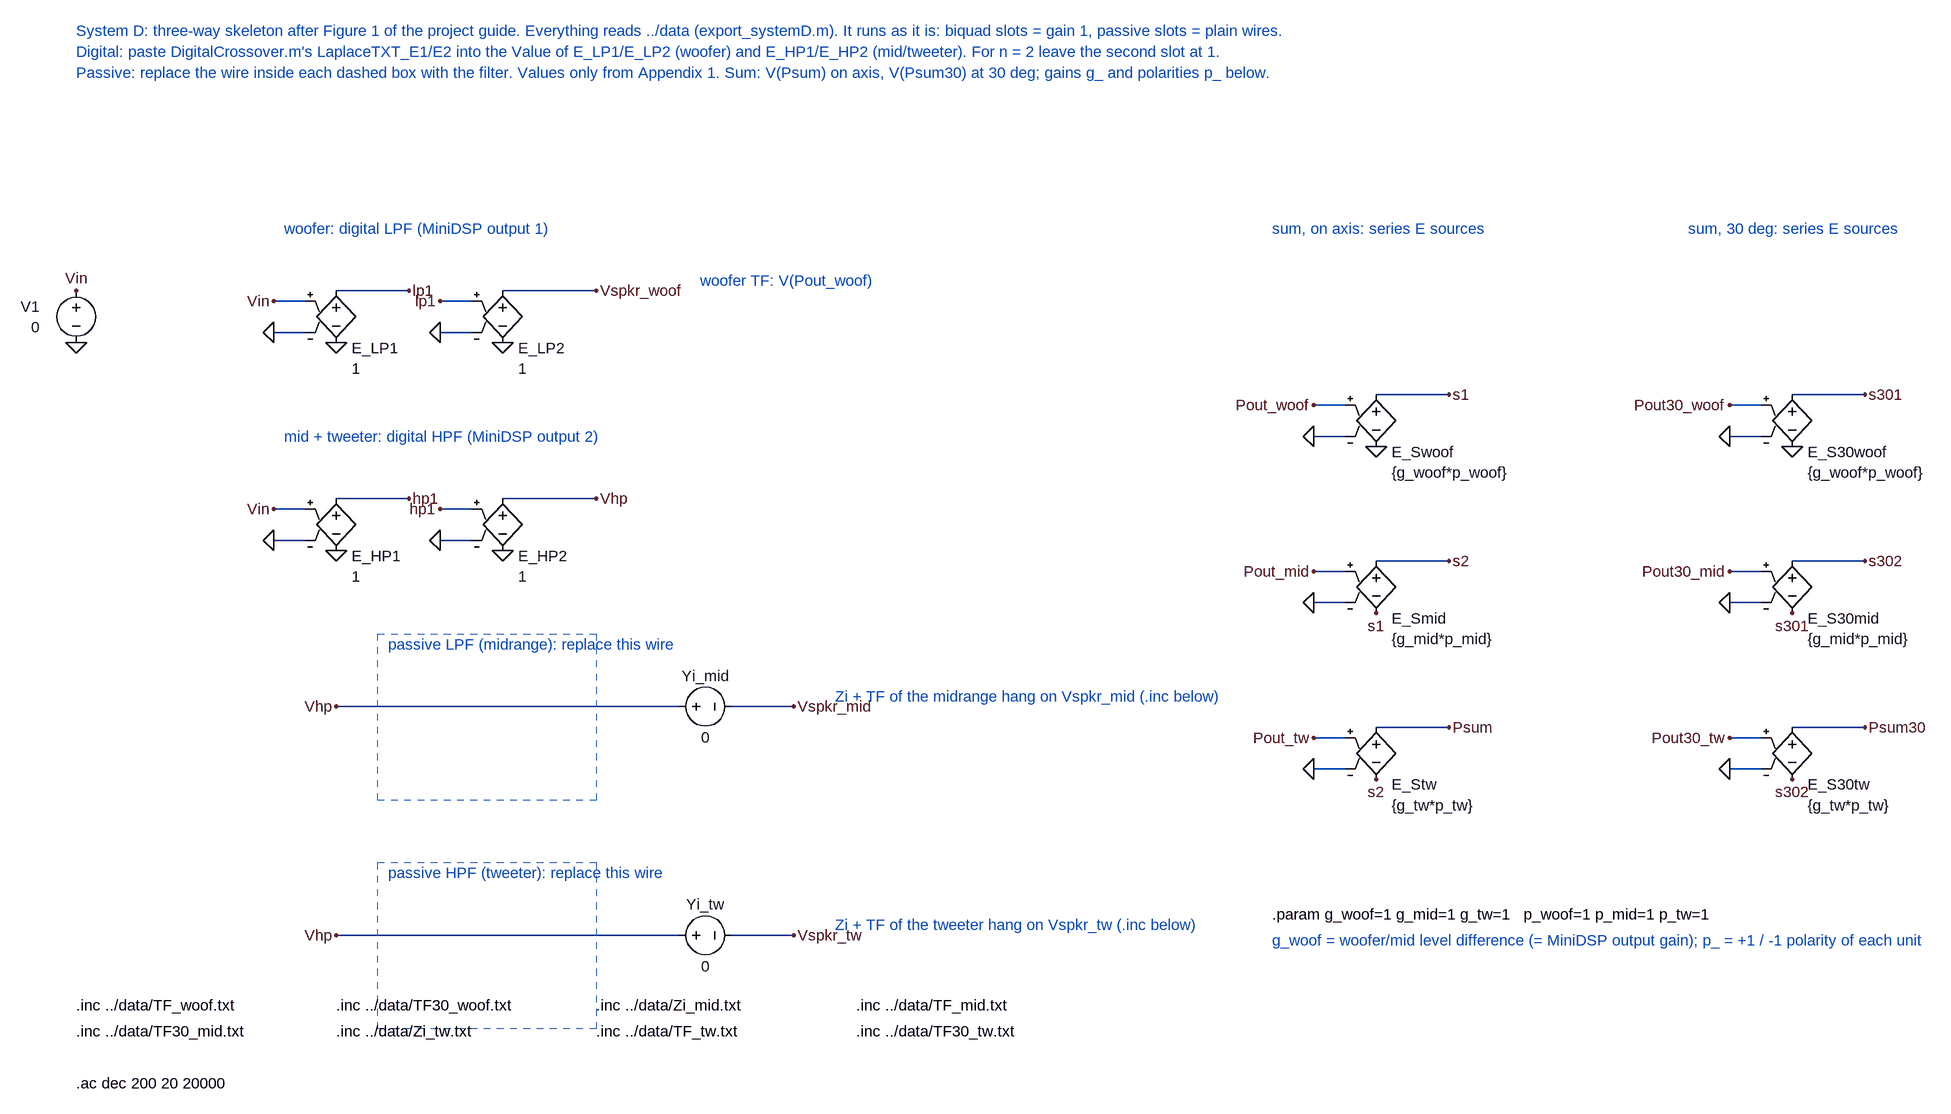
[diagram p0: schematic System_template.asc]
System_template.asc, the LTspice schematic file:
Version 4
SHEET 1 3200 1800
TEXT -400 -400 Left 2 ;System D: three-way skeleton after Figure 1 of the project guide. Everything reads ../data (export_systemD.m). It runs as it is: biquad slots = gain 1, passive slots = plain wires.
TEXT -400 -368 Left 2 ;Digital: paste DigitalCrossover.m's LaplaceTXT_E1/E2 into the Value of E_LP1/E_LP2 (woofer) and E_HP1/E_HP2 (mid/tweeter). For n = 2 leave the second slot at 1.
TEXT -400 -336 Left 2 ;Passive: replace the wire inside each dashed box with the filter. Values only from Appendix 1. Sum: V(Psum) on axis, V(Psum30) at 30 deg; gains g_ and polarities p_ below.
SYMBOL voltage -400 -16 R0
WINDOW 0 -56 40 Right 2
WINDOW 3 -56 72 Right 2
SYMATTR InstName V1
SYMATTR Value 0
SYMATTR Value2 AC 1
FLAG -400 0 Vin
FLAG -400 80 0
TEXT -80 -96 Left 2 ;woofer: digital LPF (MiniDSP output 1)
SYMBOL e 0 -16 R0
WINDOW 0 24 104 Left 2
WINDOW 3 24 136 Left 2
SYMATTR InstName E_LP1
SYMATTR Value 1
FLAG 0 80 0
WIRE -48 16 -96 16
FLAG -96 16 Vin
WIRE -48 64 -96 64
FLAG -96 64 0
WIRE 0 0 112 0
FLAG 112 0 lp1
SYMBOL e 256 -16 R0
WINDOW 0 24 104 Left 2
WINDOW 3 24 136 Left 2
SYMATTR InstName E_LP2
SYMATTR Value 1
FLAG 256 80 0
WIRE 208 16 160 16
FLAG 160 16 lp1
WIRE 208 64 160 64
FLAG 160 64 0
WIRE 256 0 400 0
FLAG 400 0 Vspkr_woof
TEXT -80 224 Left 2 ;mid + tweeter: digital HPF (MiniDSP output 2)
SYMBOL e 0 304 R0
WINDOW 0 24 104 Left 2
WINDOW 3 24 136 Left 2
SYMATTR InstName E_HP1
SYMATTR Value 1
FLAG 0 400 0
WIRE -48 336 -96 336
FLAG -96 336 Vin
WIRE -48 384 -96 384
FLAG -96 384 0
WIRE 0 320 112 320
FLAG 112 320 hp1
SYMBOL e 256 304 R0
WINDOW 0 24 104 Left 2
WINDOW 3 24 136 Left 2
SYMATTR InstName E_HP2
SYMATTR Value 1
FLAG 256 400 0
WIRE 208 336 160 336
FLAG 160 336 hp1
WIRE 208 384 160 384
FLAG 160 384 0
WIRE 256 320 400 320
FLAG 400 320 Vhp
TEXT 560 -16 Left 2 ;woofer TF: V(Pout_woof)
FLAG 0 640 Vhp
WIRE 0 640 448 640
RECTANGLE Normal 64 528 400 784 2
TEXT 80 544 Left 2 ;passive LPF (midrange): replace this wire
SYMBOL voltage 512 640 R270
WINDOW 0 32 56 VTop 2
WINDOW 3 -32 56 VBottom 2
SYMATTR InstName Yi_mid
SYMATTR Value 0
WIRE 448 640 528 640
WIRE 608 640 704 640
FLAG 704 640 Vspkr_mid
TEXT 768 624 Left 2 ;Zi + TF of the midrange hang on Vspkr_mid (.inc below)
FLAG 0 992 Vhp
WIRE 0 992 448 992
RECTANGLE Normal 64 880 400 1136 2
TEXT 80 896 Left 2 ;passive HPF (tweeter): replace this wire
SYMBOL voltage 512 992 R270
WINDOW 0 32 56 VTop 2
WINDOW 3 -32 56 VBottom 2
SYMATTR InstName Yi_tw
SYMATTR Value 0
WIRE 448 992 528 992
WIRE 608 992 704 992
FLAG 704 992 Vspkr_tw
TEXT 768 976 Left 2 ;Zi + TF of the tweeter hang on Vspkr_tw (.inc below)
TEXT 1440 -96 Left 2 ;sum, on axis: series E sources
SYMBOL e 1600 144 R0
WINDOW 0 24 104 Left 2
WINDOW 3 24 136 Left 2
SYMATTR InstName E_Swoof
SYMATTR Value {g_woof*p_woof}
FLAG 1600 240 0
WIRE 1552 176 1504 176
FLAG 1504 176 Pout_woof
WIRE 1552 224 1504 224
FLAG 1504 224 0
WIRE 1600 160 1712 160
FLAG 1712 160 s1
SYMBOL e 1600 400 R0
WINDOW 0 24 104 Left 2
WINDOW 3 24 136 Left 2
SYMATTR InstName E_Smid
SYMATTR Value {g_mid*p_mid}
FLAG 1600 496 s1
WIRE 1552 432 1504 432
FLAG 1504 432 Pout_mid
WIRE 1552 480 1504 480
FLAG 1504 480 0
WIRE 1600 416 1712 416
FLAG 1712 416 s2
SYMBOL e 1600 656 R0
WINDOW 0 24 104 Left 2
WINDOW 3 24 136 Left 2
SYMATTR InstName E_Stw
SYMATTR Value {g_tw*p_tw}
FLAG 1600 752 s2
WIRE 1552 688 1504 688
FLAG 1504 688 Pout_tw
WIRE 1552 736 1504 736
FLAG 1504 736 0
WIRE 1600 672 1712 672
FLAG 1712 672 Psum
TEXT 2080 -96 Left 2 ;sum, 30 deg: series E sources
SYMBOL e 2240 144 R0
WINDOW 0 24 104 Left 2
WINDOW 3 24 136 Left 2
SYMATTR InstName E_S30woof
SYMATTR Value {g_woof*p_woof}
FLAG 2240 240 0
WIRE 2192 176 2144 176
FLAG 2144 176 Pout30_woof
WIRE 2192 224 2144 224
FLAG 2144 224 0
WIRE 2240 160 2352 160
FLAG 2352 160 s301
SYMBOL e 2240 400 R0
WINDOW 0 24 104 Left 2
WINDOW 3 24 136 Left 2
SYMATTR InstName E_S30mid
SYMATTR Value {g_mid*p_mid}
FLAG 2240 496 s301
WIRE 2192 432 2144 432
FLAG 2144 432 Pout30_mid
WIRE 2192 480 2144 480
FLAG 2144 480 0
WIRE 2240 416 2352 416
FLAG 2352 416 s302
SYMBOL e 2240 656 R0
WINDOW 0 24 104 Left 2
WINDOW 3 24 136 Left 2
SYMATTR InstName E_S30tw
SYMATTR Value {g_tw*p_tw}
FLAG 2240 752 s302
WIRE 2192 688 2144 688
FLAG 2144 688 Pout30_tw
WIRE 2192 736 2144 736
FLAG 2144 736 0
WIRE 2240 672 2352 672
FLAG 2352 672 Psum30
TEXT 1440 960 Left 2 !.param g_woof=1 g_mid=1 g_tw=1   p_woof=1 p_mid=1 p_tw=1
TEXT 1440 1000 Left 2 ;g_woof = woofer/mid level difference (= MiniDSP output gain); p_ = +1 / -1 polarity of each unit
TEXT -400 1100 Left 2 !.inc ../data/TF_woof.txt
TEXT 0 1100 Left 2 !.inc ../data/TF30_woof.txt
TEXT 400 1100 Left 2 !.inc ../data/Zi_mid.txt
TEXT 800 1100 Left 2 !.inc ../data/TF_mid.txt
TEXT -400 1140 Left 2 !.inc ../data/TF30_mid.txt
TEXT 0 1140 Left 2 !.inc ../data/Zi_tw.txt
TEXT 400 1140 Left 2 !.inc ../data/TF_tw.txt
TEXT 800 1140 Left 2 !.inc ../data/TF30_tw.txt
TEXT -400 1220 Left 2 !.ac dec 200 20 20000

The netlist it stands for:
* System_template.asc
V1 Vin 0 0 AC 1
E_LP1 lp1 0 Vin 0 1
E_LP2 Vspkr_woof 0 lp1 0 1
E_HP1 hp1 0 Vin 0 1
E_HP2 Vhp 0 hp1 0 1
V§Yi_mid Vhp Vspkr_mid 0
V§Yi_tw Vhp Vspkr_tw 0
E_Swoof s1 0 Pout_woof 0 {g_woof*p_woof}
E_Smid s2 s1 Pout_mid 0 {g_mid*p_mid}
E_Stw Psum s2 Pout_tw 0 {g_tw*p_tw}
E_S30woof s301 0 Pout30_woof 0 {g_woof*p_woof}
E_S30mid s302 s301 Pout30_mid 0 {g_mid*p_mid}
E_S30tw Psum30 s302 Pout30_tw 0 {g_tw*p_tw}
* System D: three-way skeleton after Figure 1 of the project guide. Everything reads ../data (export_systemD.m). It runs as it is: biquad slots = gain 1, passive slots = plain wires.
* Digital: paste DigitalCrossover.m's LaplaceTXT_E1/E2 into the Value of E_LP1/E_LP2 (woofer) and E_HP1/E_HP2 (mid/tweeter). For n = 2 leave the second slot at 1.
* Passive: replace the wire inside each dashed box with the filter. Values only from Appendix 1. Sum: V(Psum) on axis, V(Psum30) at 30 deg; gains g_ and polarities p_ below.
* woofer: digital LPF (MiniDSP output 1)
* mid + tweeter: digital HPF (MiniDSP output 2)
* woofer TF: V(Pout_woof)
* passive LPF (midrange): replace this wire
* Zi + TF of the midrange hang on Vspkr_mid (.inc below)
* passive HPF (tweeter): replace this wire
* Zi + TF of the tweeter hang on Vspkr_tw (.inc below)
* sum, on axis: series E sources
* sum, 30 deg: series E sources
.param g_woof=1 g_mid=1 g_tw=1   p_woof=1 p_mid=1 p_tw=1
* g_woof = woofer/mid level difference (= MiniDSP output gain); p_ = +1 / -1 polarity of each unit
.inc ../data/TF_woof.txt
.inc ../data/TF30_woof.txt
.inc ../data/Zi_mid.txt
.inc ../data/TF_mid.txt
.inc ../data/TF30_mid.txt
.inc ../data/Zi_tw.txt
.inc ../data/TF_tw.txt
.inc ../data/TF30_tw.txt
.ac dec 200 20 20000
.backanno
.end